# Altium schematic sheet Connections.SchDoc: =DT_SCH_Title
size A3; Organization: Droid Technologies
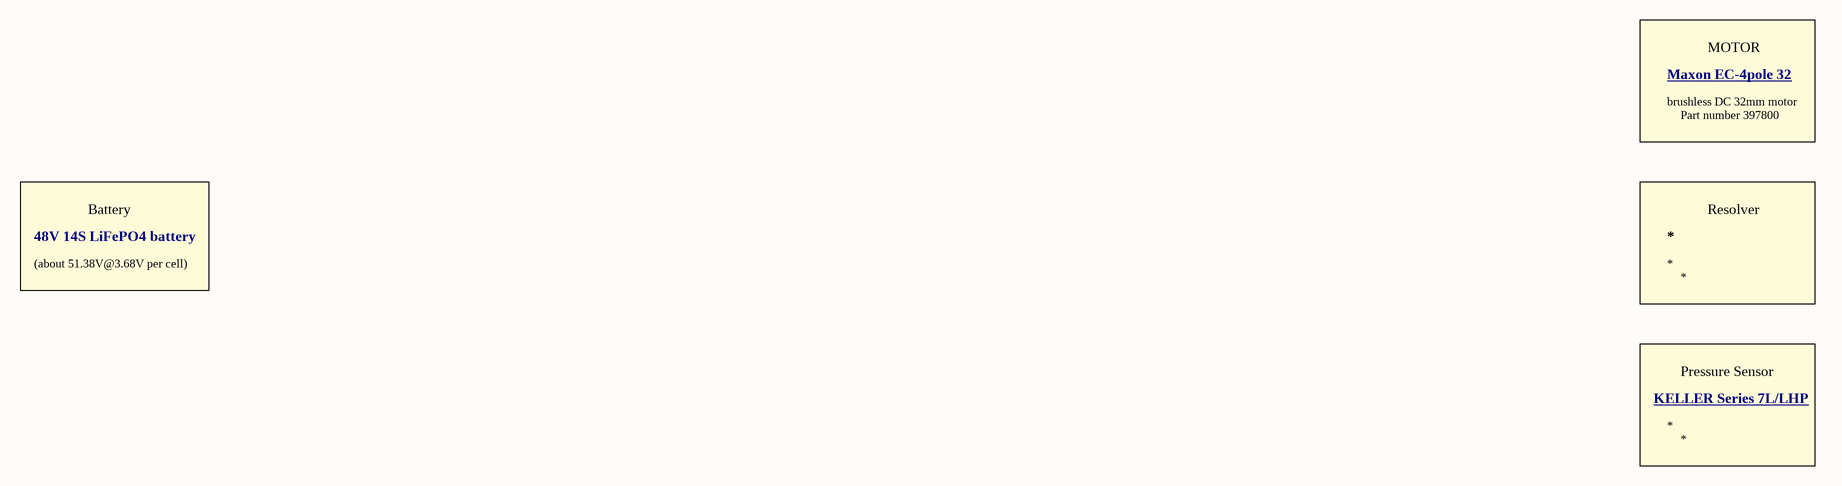
[diagram p0: Connections.SchDoc]

## Notes on the sheet
- MOTOR
- Maxon EC-4pole 32 <https://www.maxongroup.us/maxon/view/product/motor/ecmotor/ec4pole/397800>
- brushless DC 32mm motor
- Part number 397800
- 48V 14S LiFePO4 battery
- Battery
- *
- Resolver
- (about 51.38V@3.68V per cell)
- Pressure Sensor
- KELLER Series 7L/LHP <https://download.keller-pressure.com/api/download/C88AJ8DXftpGtXGN9dXUXE/en/2023-07.pdf>
- Title
- Size:
- A4
- Number:
- Revision:
- Date:
- Time:
- Sheet
- of